# Altium schematic sheet Sheet6.SchDoc
size A; SheetNumber: 5; SheetTotal: 10
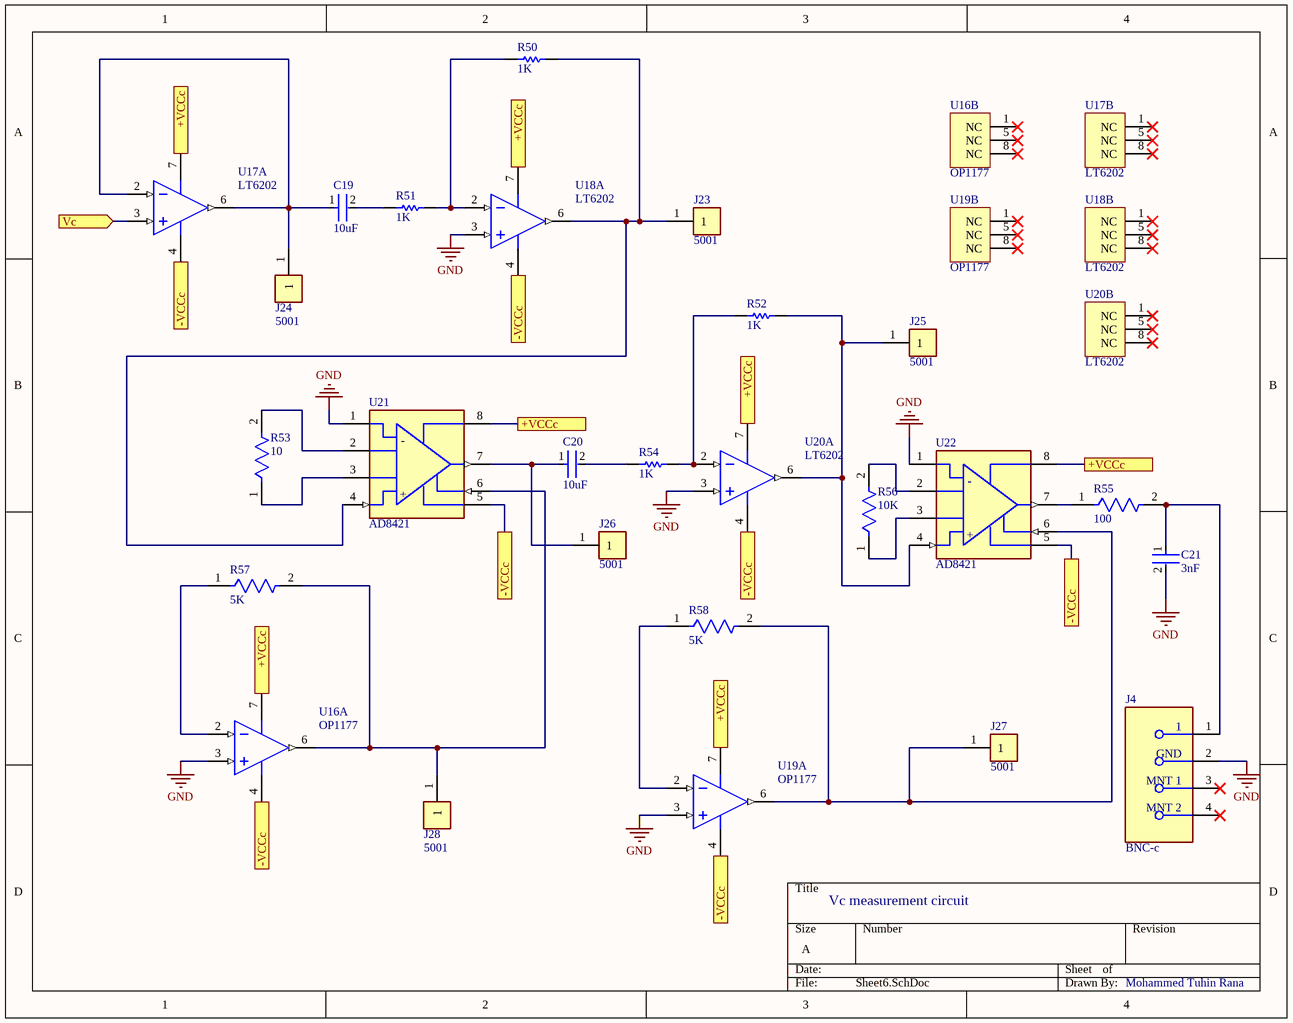
[diagram p0: Sheet6.SchDoc]

## Parts
C19  10uF  [FP-GRM21B-0_1-IPC_C]
C20  10uF  [FP-GRM21B-0_1-IPC_C]
C21  3nF  [FP-C1206C-EB-MFG]
J4  BNC-c  [FP-5413194-2-MFG]
J23  5001  [FP-5001-MFG]
J24  5001  [FP-5001-MFG]
J25  5001  [FP-5001-MFG]
J26  5001  [FP-5001-MFG]
J27  5001  [FP-5001-MFG]
J28  5001  [FP-5001-MFG]
R50  1K  [RESC3216X70X50ML20T25]
R51  1K  [RESC3216X70X50ML20T25]
R52  1K  [RESC3216X70X50ML20T25]
R53  10  [FP-RT0603-MFG]
R54  1K  [RESC3216X70X50ML20T25]
R55  100  [FP-ERA3A-IPC_B]
R56  10K  [FP-ERJPA3-IPC_A]
R57  5K  [FP-RT1206-0_65-MFG]
R58  5K  [FP-RT1206-0_65-MFG]
U16  OP1177  [ADI-R-8_N]  (parts A,B of 2)
U17  LT6202  [LT-S8-8_N]  (parts A,B of 2)
U18  LT6202  [LT-S8-8_N]  (parts A,B of 2)
U19  OP1177  [ADI-R-8_N]  (parts A,B of 2)
U20  LT6202  [LT-S8-8_N]  (parts A,B of 2)
U21  AD8421  [FP-R-8-IPC_C]
U22  AD8421  [FP-R-8-IPC_C]

## Ports
+VCCc (see Sheet6[1A], Sheet6[1C], Sheet6[2A], Sheet6[2B], Sheet6[3B], Sheet6[3C], Sheet9[4B]), +VCCc (see Sheet6[1A], Sheet6[1C], Sheet6[2A], Sheet6[2B], Sheet6[3B], Sheet6[4B], Sheet9[4B]), +VCCc (see Sheet6[1A], Sheet6[1C], Sheet6[2A], Sheet6[2B], Sheet6[3C], Sheet6[4B], Sheet9[4B]), +VCCc (see Sheet6[1A], Sheet6[1C], Sheet6[2A], Sheet6[3B], Sheet6[3C], Sheet6[4B], Sheet9[4B]), +VCCc (see Sheet6[1A], Sheet6[1C], Sheet6[2B], Sheet6[3B], Sheet6[3C], Sheet6[4B], Sheet9[4B]), +VCCc (see Sheet6[1A], Sheet6[2A], Sheet6[2B], Sheet6[3B], Sheet6[3C], Sheet6[4B], Sheet9[4B]), +VCCc (see Sheet6[1C], Sheet6[2A], Sheet6[2B], Sheet6[3B], Sheet6[3C], Sheet6[4B], Sheet9[4B]), -VCCc (see Sheet6[1B], Sheet6[1D], Sheet6[2B], Sheet6[2C], Sheet6[3C], Sheet6[3D], Sheet9[3B]), -VCCc (see Sheet6[1B], Sheet6[1D], Sheet6[2B], Sheet6[2C], Sheet6[3C], Sheet6[4C], Sheet9[3B]), -VCCc (see Sheet6[1B], Sheet6[1D], Sheet6[2B], Sheet6[2C], Sheet6[3D], Sheet6[4C], Sheet9[3B]), -VCCc (see Sheet6[1B], Sheet6[1D], Sheet6[2B], Sheet6[3C], Sheet6[3D], Sheet6[4C], Sheet9[3B]), -VCCc (see Sheet6[1B], Sheet6[1D], Sheet6[2C], Sheet6[3C], Sheet6[3D], Sheet6[4C], Sheet9[3B]), -VCCc (see Sheet6[1B], Sheet6[2B], Sheet6[2C], Sheet6[3C], Sheet6[3D], Sheet6[4C], Sheet9[3B]), -VCCc (see Sheet6[1D], Sheet6[2B], Sheet6[2C], Sheet6[3C], Sheet6[3D], Sheet6[4C], Sheet9[3B]), Vc (in, see Sheet2[3B])

## Nets
GND: C21.2 J4.2(GND) U16.3(+IN) U18.3(+IN) U19.3(+IN) U20.3(+IN) U21.1(-IN) U22.1(-IN)
+VCCc: U16.7(+V) U17.7(V+) U18.7(V+) U19.7(+V) U20.7(V+) U21.8(+VS) U22.8(+VS) ; port +VCCc
-VCCc: U16.4(-V) U17.4(V-) U18.4(V-) U19.4(-V) U20.4(V-) U21.5(-VS) U22.5(-VS) ; port -VCCc
Vc: U17.3(+IN) ; port Vc
NetC19_1: C19.1 J24.1 U17.2(-IN) U17.6(OUT)
NetC19_2: C19.2 R51.1
NetC20_1: C20.1 J26.1 U21.7(VOUT)
NetC20_2: C20.2 R54.1
NetC21_1: C21.1 J4.1 R55.2
NetJ23_1: J23.1 R50.2 U18.6(OUT) U21.4(+IN)
NetJ25_1: J25.1 R52.2 U20.6(OUT) U22.4(+IN)
NetJ27_1: J27.1 R58.2 U19.6(OUT) U22.6(REF)
NetJ28_1: J28.1 R57.2 U16.6(OUT) U21.6(REF)
NetR50_1: R50.1 R51.2 U18.2(-IN)
NetR52_1: R52.1 R54.2 U20.2(-IN)
NetR53_1: R53.1 U21.3(2_RG)
NetR53_2: R53.2 U21.2(1_RG)
NetR55_1: R55.1 U22.7(VOUT)
NetR56_1: R56.1 U22.3(2_RG)
NetR56_2: R56.2 U22.2(1_RG)
NetR57_1: R57.1 U16.2(-IN)
NetR58_1: R58.1 U19.2(-IN)

Not connected (* = marked no-connect by the designer): J4 3(MNT_1)* 4(MNT_2)*; U16 1(NC)* 5(NC)* 8(NC)*; U17 1(NC)* 5(NC)* 8(NC)*; U18 1(NC)* 5(NC)* 8(NC)*; U19 1(NC)* 5(NC)* 8(NC)*; U20 1(NC)* 5(NC)* 8(NC)*

## Notes on the sheet
- Vc measurement circuit
- Mohammed Tuhin Rana
- (in symbol CMP-09116-000012-1) -; +

## Library data of the parts
C19 C20 = CMP-2007-03453-2: Chip Multilayer Ceramic Capacitors for General Purpose, 0805, 10uF, X5R, 15%, 10%, 16V; Radiation Hardening: No; Thickness: 0.053inch; Voltage Rating (DC): 16V; Lead Free: Lead Free; Package Quantity: 1; Width: 1.25mm; Case Code (Imperial): 0805; Depth: 1.25mm; Packaging: Tape and Reel; Dielectric: X5R; Max Operating Temperature: 85°C; Tolerance: 10%; Voltage Rating: 16V; Voltage: 16V; Capacitance: 10uF; Height: 1.25mm; Case Code (Metric): 2012; Material: Ceramic; Mount: Surface Mount; Case/Package: 0805; REACH SVHC: No SVHC; Length: 2mm; Min Operating Temperature: -55°C; Termination: SMD/SMT
C21 = CMP-1037-02920-2: CAP CER 3000PF 50V NP0 1206; Manufacturer Part Number: C1206C302J5GACTU; Manufacturer: KEMET; Value: 3,000 pF; Temperature Coefficient: 15%; Tolerance: 0.05; Material: Ceramic; Automotive Grade: Grade 0; Temperature Characteristic: C0G; ComponentLink2URL: https://content.kemet.com/datasheets/KEM_C1007_X8R_ULTRA_150C_SMD.pdf; Device Class L3: Ceramic Capacitors; Device Class L2: Capacitors; ComponentLink2Description: Datasheet; Automotive: Yes; Temperature Range Low: -55°C; Temperature: -55°C to +150°C; Octopart: https://octopart.com/c1206c302j5gactu-kemet-12776246; Height: 0.88mm; Lead Free: Yes; Device Class L1: Passive Components; Digikey Description: CAP CER 3000PF 50V NP0 1206; Category: Cap; Mouser Description: Capacitor, Ceramic, 3Nf, 50Vdc, 5-% Tol, 5+% Tol, C0g-Tc Code, -30, 30Ppm-Tc Rohs Compliant: Yes; RoHS: TRUE; Ipc Land Pattern Name: CAPC320160X78; Voltage Rating: 50 V; Capacitance: 3,000 pF; Temperature Range High: +150°C; Package: C1206C-EB
J4 = CMP-03790-39547162-1: 5413194-2 RF BNC Connector, 1 Contact(s), Female, Panel Mount, Solder Terminal, Locking, Jack; Manufacturer Lifecycle Status: ACTIVE; Impedance: 75Ω; Number of Positions: 1; Outside Diameter: 14.529mm; Polarity: Normal, Standard; Sealable: No; Dielectric Material: Polymethylpentene; PCB Mounting Orientation: Right Angle; Voltage Rating: 500V; Body Plating: Nickel; Frequency: 2GHz; Tail Length: 4.11mm; Insulation Resistance: 5GΩ; Body Material: Zinc; ELV: Compliant; Lead Free: Lead Free; Radiation Hardening: No; Gender: Female; Color: Black; Mount: Panel, Through Hole; Packaging: Bulk; NexarPartId: 39547162; Housing Color: Black; Fastening Type: Bayonet; Contact Gender: Female; Lifecycle Status: Production; Depth: 34.93mm; Min Operating Temperature: -55°C; Number of Contacts: 1; RoHS: Compliant; Length: 14.76mm; Insulation Material: Polymethylpentene; Termination: Solder, Through Hole; Connector Type: BNC; Contact Plating: Gold; Max Frequency: 2GHz; Max Operating Temperature: 85°C; Height: 13.18mm; REACH SVHC: Unknown; Orientation: Right Angle; Contact Material: Copper
J23-J28 = CMP-2000-05181-2: PC TEST POINT MINIATURE BLACK; Body Material: Bronze; Plating: Silver; Inside Diameter: 1.27mm; Hole Diameter: 1.6mm; Number of Ports: 1; Outside Diameter: 2.54mm; Insulation: Insulated; Insulation Material: Nylon; Mount: Through Hole; RoHS Compliant: Yes; Series: THM; Height: 0.3inch; Termination: Through Hole; Material: Nylon; Packaging: Bulk; Contact Material: Bronze; REACH SVHC: No SVHC; Contact Plating: Silver; Orientation: Straight; Lead Free: Lead Free; Package Quantity: 100; Length: 7.62mm; Flammability Rating: UL94 V-0; Number of Contacts: 1; Diameter: 2.54mm; Housing Color: Black; Color: Black
R50-R52 R54 = CMP-2003-04406-1: Part Number: ERA8AEB102V; Manufacturer: Panasonic
R53 = CMP-2000-04347-2: RES SMD 10 OHM 0.1% 1/10W 0603; Manufacturer: Yageo; Manufacturer Part Number: RT0603BRD0710RL; Resistance: 10Ω; Temperature Coefficient: 25 ppm/°C; Power Rating: 0.1W; Tolerance: 0.001; Voltage Rating: 75V; Value: 10Ω; Height: 0.55mm; Temperature Range Low: -55°C; Temperature Range High: +155°C; Package: RT0603; Digikey Description: RES SMD 10 OHM 0.1% 1/10W 0603; Lead Free: Yes; Ipc Land Pattern Name: RESC16080X45; Mouser Description: Thin Film Resistors - SMD 1/10W 10 ohm .1% 25ppm; Automotive: No; Footprint Url: http://www.yageo.com/exep/pages/download/literatures/PYu-R_Mount_10.pdf; Series: RT; Device Class L3: Chip SMD Resistors; Device Class L2: Resistors; Octopart: https://octopart.com/rt0603brd0710rl-yageo-1216748; Temperature: -55°C to +155°C; Composition: Thin Film; Category: Res; ComponentLink2Description: Datasheet; Device Class L1: Passive Components; RoHS: TRUE; ComponentLink2URL: http://www.yageo.com/documents/recent/PYu-RT_1-to-0.01_RoHS_L_9.pdf
R55 = CMP-2000-00870-2: RES SMD 100 OHM 0.1% 1/10W 0603; Voltage Rating: 75V; Power Rating: 100mW; Resistance: 100R; Temperature Coefficient: 25ppm/°C; Number of Terminations: 2; Case/Package: 0603; Termination: SMD/SMT; Number of Pins: 2; Size Code: 0603; Length: 1.6mm; Min Operating Temperature: -55°C; Resistor Type: Thin Film; Depth: 0.8mm; Military Standard: Not; Packaging: Tape and Reel; RoHS Compliant: Yes; Construction: Rectangular; Resistance Tolerance: 0.1%; Contact Plating: Tin; Width: 0.8mm; Mount: Surface Mount; Case Code (Metric): 1608; Max Operating Temperature: 155°C; Height: 0.45mm; Case Code (Imperial): 0603; Series: ERA-3A; Package Quantity: 5000; REACH SVHC: No SVHC; Tolerance: 0.1%; Max Power Dissipation: 100mW; Radiation Hardening: No; Technology: METAL FILM
R56 = CMP-05422-000155-1: RES SMD 10K OHM 1% 1/3W 0603; RoHS Compliant: Yes
R57 R58 = CMP-03412-001731-1: RES SMD 5K OHM 0.1% 1/4W 1206; Manufacturer: Yageo; Manufacturer Part Number: RT1206BRD075KL; Resistance: 5kΩ; Value: 5kΩ; Power Rating: 0.25W; Voltage Rating: 200V; Temperature Coefficient: 25ppm/°C; Series: RT; Mouser Description: Thin Film Resistors - SMD 1/4W 5K ohm .1% 25ppm; Temperature: -55°C to +155°C; Composition: Thin Film; Footprint Url: https://www.yageo.com/upload/website/yageo_PYu-R_Mount_10_19050818_343.pdf; Device Class L1: Passive Components; Temperature Range High: +155°C; Octopart: https://octopart.com/rt1206brd075kl-yageo-29806230; Ipc Land Pattern Name: RESC310160X55; Device Class L3: Chip SMD Resistors; Temperature Range Low: -55°C; Height: 0.65mm; ComponentLink2URL: https://www.yageo.com/upload/media/product/productsearch/datasheet/rchip/PYu-RT_1-to-0.01_RoHS_L_11.pdf; Automotive: No; Category: Res; ComponentLink2Description: Datasheet; Package: RT1206-0.65; Lead Free: Yes; Digikey Description: RES SMD 5K OHM 0.1% 1/4W 1206; Device Class L2: Resistors; RoHS: TRUE; Tolerance: 0.1%
U16 U19 = CMP-0384-00640-2: Single Channel Wide Bandwidth Operational Amplifier, 1.3 MHz BW, 700 mV/us SR, Industrial, 8-pin SOIC (R-8), Reel; PartNumber: OP1177ARZ-REEL7; Manufacturer: Analog Devices; Iq/Amp: 500uA; V Span Max: 36V; Input Bias Current: 500pA; Amplifiers Per Package: 1; Small Signal Bandwidth: 1.3MHz; V Span Min: 5V; Input Offset Voltage: 15uV; ComponentLink2Description: Datasheet; ComponentLink4URL: http://www.analog.com/en/all-operational-amplifiers-op-amps/operational-amplifiers-op-amps/op1177/products/product.html#product-recommendations; ComponentLink3Description: Package Specification; PackageDescription: 8-Pin Standard Small Outline Package, Body 3.9 x 4.9 mm, Pitch 1.27 mm; ComponentLink1URL: http://www.analog.com/en/index.html; PackageReference: R-8; PackageVersion: 060506-A; DatasheetVersion: Rev. G; ComponentLink4Description: Reference Circuit; ComponentLink1Description: Manufacturer URL; Mounting Technology: Surface Mount; RevisionNote: Reference Circuit URL fixed; ComponentLink3URL: http://www.analog.com/static/imported-files/packages/PKG_PDF/SOIC_Narrow%20(R)/R_8.pdf; Code_JEDEC: MS-012-AA; Slew Rate: 700mV/us; ComponentLink2URL: http://www.analog.com/static/imported-files/data_sheets/OP1177_2177_4177.pdf; Generic Part Number: OP1177
U17 U18 U20 = CMP-0359-02644-2: Single Channel, Low Noise, High Speed Operational Amplifier, RRIO, 100 MHz Typical GBW, 25 V/us Typical SR, 2.5 to 12.6 V, 8-Pin SOIC (S8-8), Commercial, Pb-Free; Manufacturer: Linear Technology; PartNumber: LT6202CS8#PBF; Channels (#): 1; Vs Min (V): 2.5; Is (mA) Typical: 2.8; Vos (mV) Typical: 0.1; Vos (mV) Guaranteed: 0.5; GBW (MHz) Typical: 100; Vs Max (V): 12.6; SR (V/us) Typical: 25; RevisionNote: URLs updated; ComponentLink2URL: http://cds.linear.com/docs/en/datasheet/620234fd.pdf; PackageDescription: 8-Pin Plastic Small Outline, Body 4.9 x 3.9 mm, Pitch 1.27 mm; Linear Technology Part Number: LT6202; RoHS: Pb-Free; ComponentLink3Description: Package Specification; ComponentLink2Description: Datasheet; PackageVersion: Rev G; ComponentLink3URL: http://cds.linear.com/docs/en/packaging/05081610_G_SO8.pdf; ComponentLink1Description: Manufacturer URL; DatasheetVersion: Rev. D; PackageReference: LT-S8-8; Mounting Technology: Surface Mount; ComponentLink1URL: http://www.linear.com/; Type: VFB
U21 U22 = CMP-09116-000012-1: IC OPAMP INSTR 10MHZ 8SOIC; Manufacturer: Analog Devices; Manufacturer Part Number: AD8421ARZ-R7; Number Of Channels: 1; Min Supply Voltage: 5V; Max Dual Supply Voltage: 18V; Input Offset Voltage: 0.07mV; Standoff Height: 0.1mm; Min Dual Supply Voltage: 2.5V; Nominal Supply Current: 2mA; Max Supply Voltage: 36V; Input Bias Current: 0.001uA; Max Junction Temp: +150°C; Lead Free: Yes; Temperature: -40°C to +85°C; Device Class L1: Integrated Circuits (ICs); Temperature Range Low: -40°C; Automotive: No; RoHS: TRUE; Bandwidth: 10MHz; Package: R-8; Temperature Range High: +85°C; Octopart: https://octopart.com/ad8421arz-r7-analog+devices-21054779; Digikey Description: IC OPAMP INSTR 10MHZ 8SOIC; Device Class L2: Linear ICs; ComponentLink2Description: Datasheet; Category: IC; ComponentLink2URL: https://www.analog.com/media/en/technical-documentation/data-sheets/AD8421.pdf; Height: 1.75mm; Mouser Description: Instrumentation Amplifiers 3nV/Hz Low Power; Device Class L3: Instrumentation